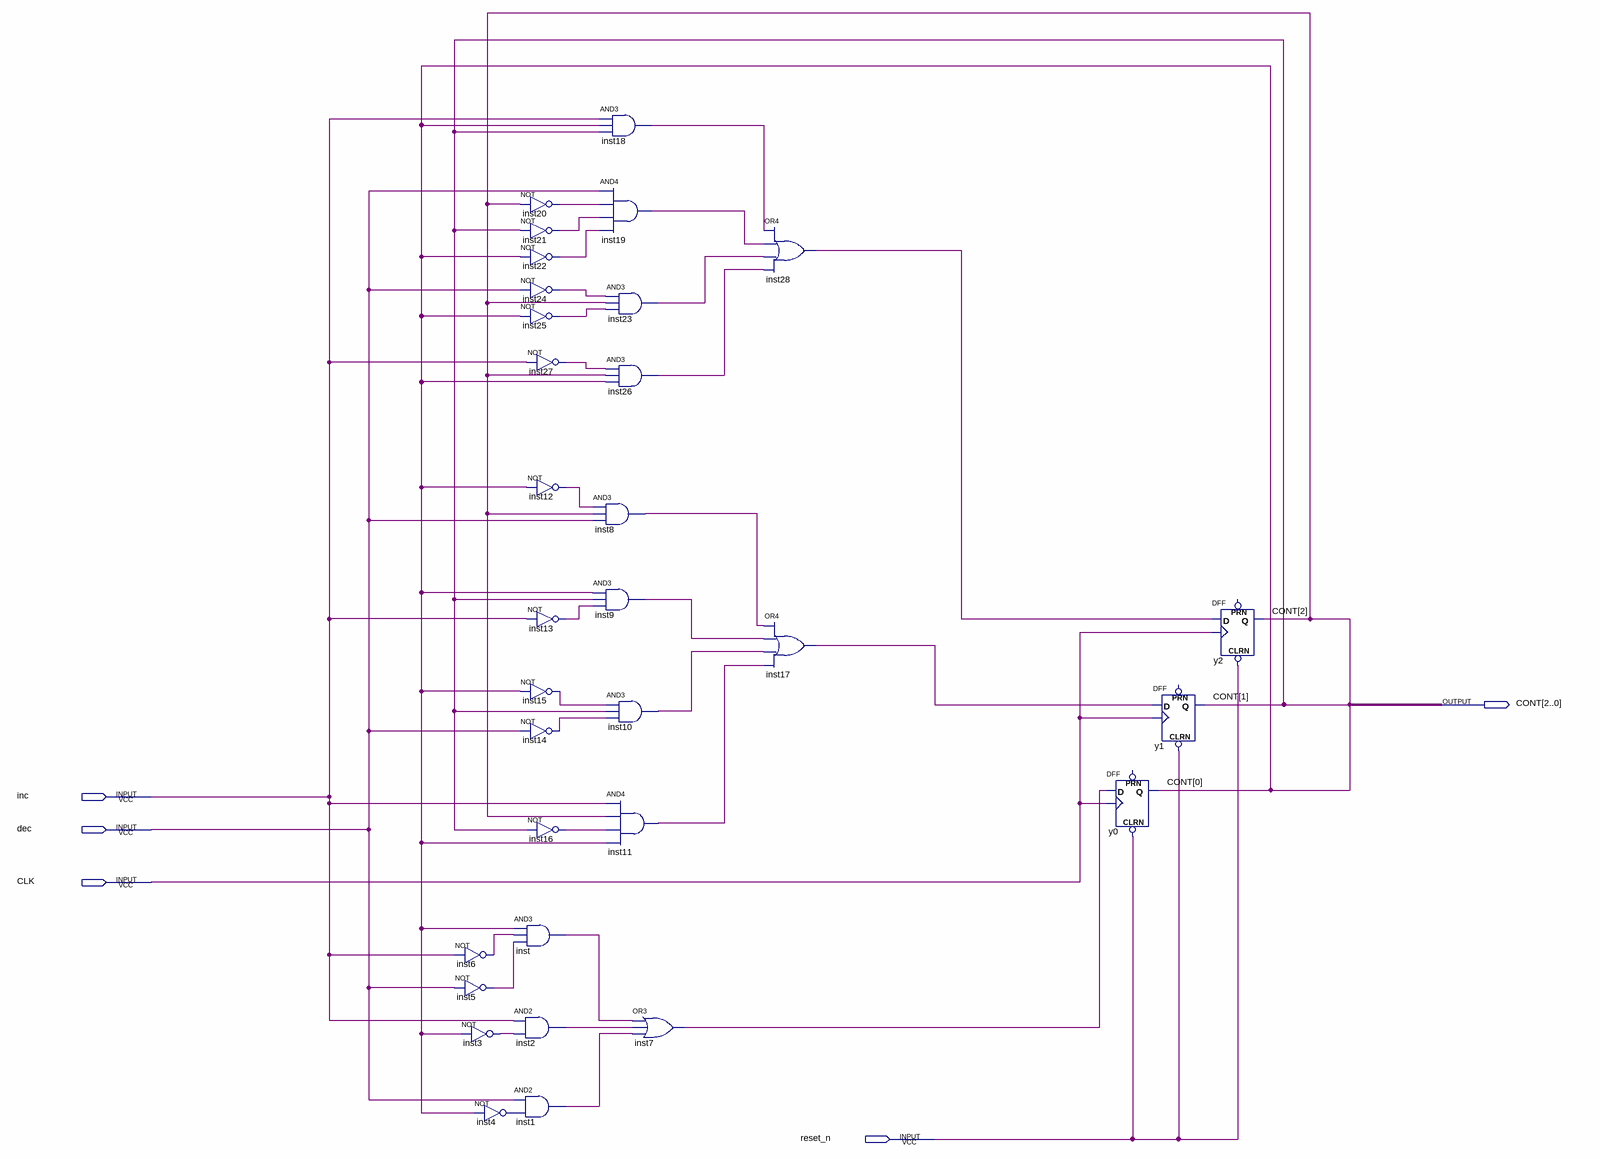
[diagram p0: schematic sheet]
// Quartus schematic contador_6.bdf as structural Verilog: 32 symbols, 5 pins
module contador_6 (
  input  inc,
  input  dec,
  input  CLK,
  input  reset_n,
  output [2:0] CONT
);

  wire inst1_out, inst2_out, inst3_out, inst4_out, inst5_out, inst6_out, inst7_out, inst8_out, inst9_out,
       inst10_out, inst11_out, inst12_out, inst13_out, inst14_out, inst15_out, inst16_out, inst17_out,
       inst18_out, inst19_out, inst20_out, inst21_out, inst22_out, inst23_out, inst24_out, inst25_out,
       inst26_out, inst27_out, inst28_out, inst_out;

  not inst6 (inst6_out, inc);
  not inst5 (inst5_out, dec);
  not inst3 (inst3_out, CONT[0]);
  not inst20 (inst20_out, CONT[2]);
  not inst21 (inst21_out, CONT[1]);
  not inst22 (inst22_out, CONT[0]);
  not inst24 (inst24_out, dec);
  not inst25 (inst25_out, CONT[0]);
  not inst15 (inst15_out, CONT[0]);
  not inst14 (inst14_out, dec);
  and inst (inst_out, CONT[0], inst6_out, inst5_out);
  and inst2 (inst2_out, inc, inst3_out);
  and inst1 (inst1_out, dec, inst4_out);
  not inst4 (inst4_out, CONT[0]);
  not inst27 (inst27_out, inc);
  not inst12 (inst12_out, CONT[0]);
  not inst13 (inst13_out, inc);
  not inst16 (inst16_out, CONT[1]);
  and inst18 (inst18_out, inc, CONT[0], CONT[1]);
  and inst19 (inst19_out, dec, inst20_out, inst21_out, inst22_out);
  and inst23 (inst23_out, inst24_out, CONT[2], inst25_out);
  and inst26 (inst26_out, inst27_out, CONT[2], CONT[0]);
  and inst8 (inst8_out, inst12_out, CONT[2], dec);
  and inst9 (inst9_out, CONT[0], CONT[1], inst13_out);
  and inst10 (inst10_out, inst15_out, CONT[1], inst14_out);
  and inst11 (inst11_out, inc, CONT[2], inst16_out, CONT[0]);
  or inst7 (inst7_out, inst_out, inst2_out, inst1_out);
  or inst28 (inst28_out, inst18_out, inst19_out, inst23_out, inst26_out);
  or inst17 (inst17_out, inst8_out, inst9_out, inst10_out, inst11_out);
  DFF y1 (.CLRN(reset_n), .CLK(CLK), .D(inst17_out), .Q(CONT[1]));  // open: PRN
  DFF y0 (.CLRN(reset_n), .CLK(CLK), .D(inst7_out), .Q(CONT[0]));  // open: PRN
  DFF y2 (.CLRN(reset_n), .CLK(CLK), .D(inst28_out), .Q(CONT[2]));  // open: PRN
endmodule
